# Altium schematic sheet Edge Connector PCB with Solder Pads.SchDoc
size A4; SheetNumber: 1; SheetTotal: 1
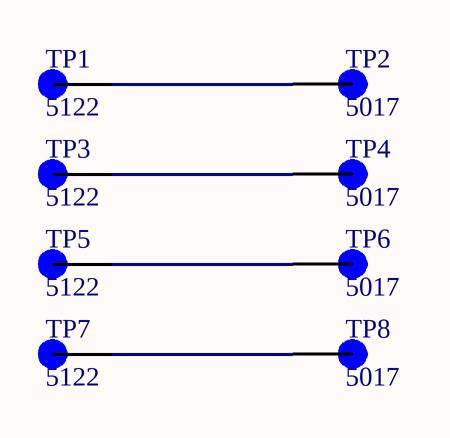
[diagram p0: Edge Connector PCB with Solder Pads.SchDoc]

## Parts
TP1  5122  [KEYSTONE_5122]
TP2  5017  [KEYSTONE_5017]
TP3  5122  [KEYSTONE_5122]
TP4  5017  [KEYSTONE_5017]
TP5  5122  [KEYSTONE_5122]
TP6  5017  [KEYSTONE_5017]
TP7  5122  [KEYSTONE_5122]
TP8  5017  [KEYSTONE_5017]

## Nets
NetTP1_TP: TP1.TP TP2.TP
NetTP3_TP: TP3.TP TP4.TP
NetTP5_TP: TP5.TP TP6.TP
NetTP7_TP: TP7.TP TP8.TP

## Library data of the parts
TP1 TP3 TP5 TP7 = 5122: Blue PC Test Point, Compact Phosphor Bronze Silver Plating 0.063 (1.60mm) Hole Diameter Mounting Type; MF: Keystone Electronics; Purchase-URL: https://pricing.snapeda.com/search?q=5122&ref=eda; Package: None; Check_prices: https://www.snapeda.com/parts/5122/Keystone+Electronics/view-part/?ref=eda; Value: *; SnapEDA_Link: https://www.snapeda.com/parts/5122/Keystone+Electronics/view-part/?ref=snap; MP: 5122; Digi-Key_Part_Number: 36-5122-ND
TP2 TP4 TP6 TP8 = 5017: SMT Test Point- Micro Mininature-5000 pc Reels; MF: Keystone Electronics; SnapEDA_Link: https://www.snapeda.com/parts/5017/Keystone+Electronics/view-part/?ref=snap; Package: None; Value: *; MP: 5017; Check_prices: https://www.snapeda.com/parts/5017/Keystone+Electronics/view-part/?ref=eda